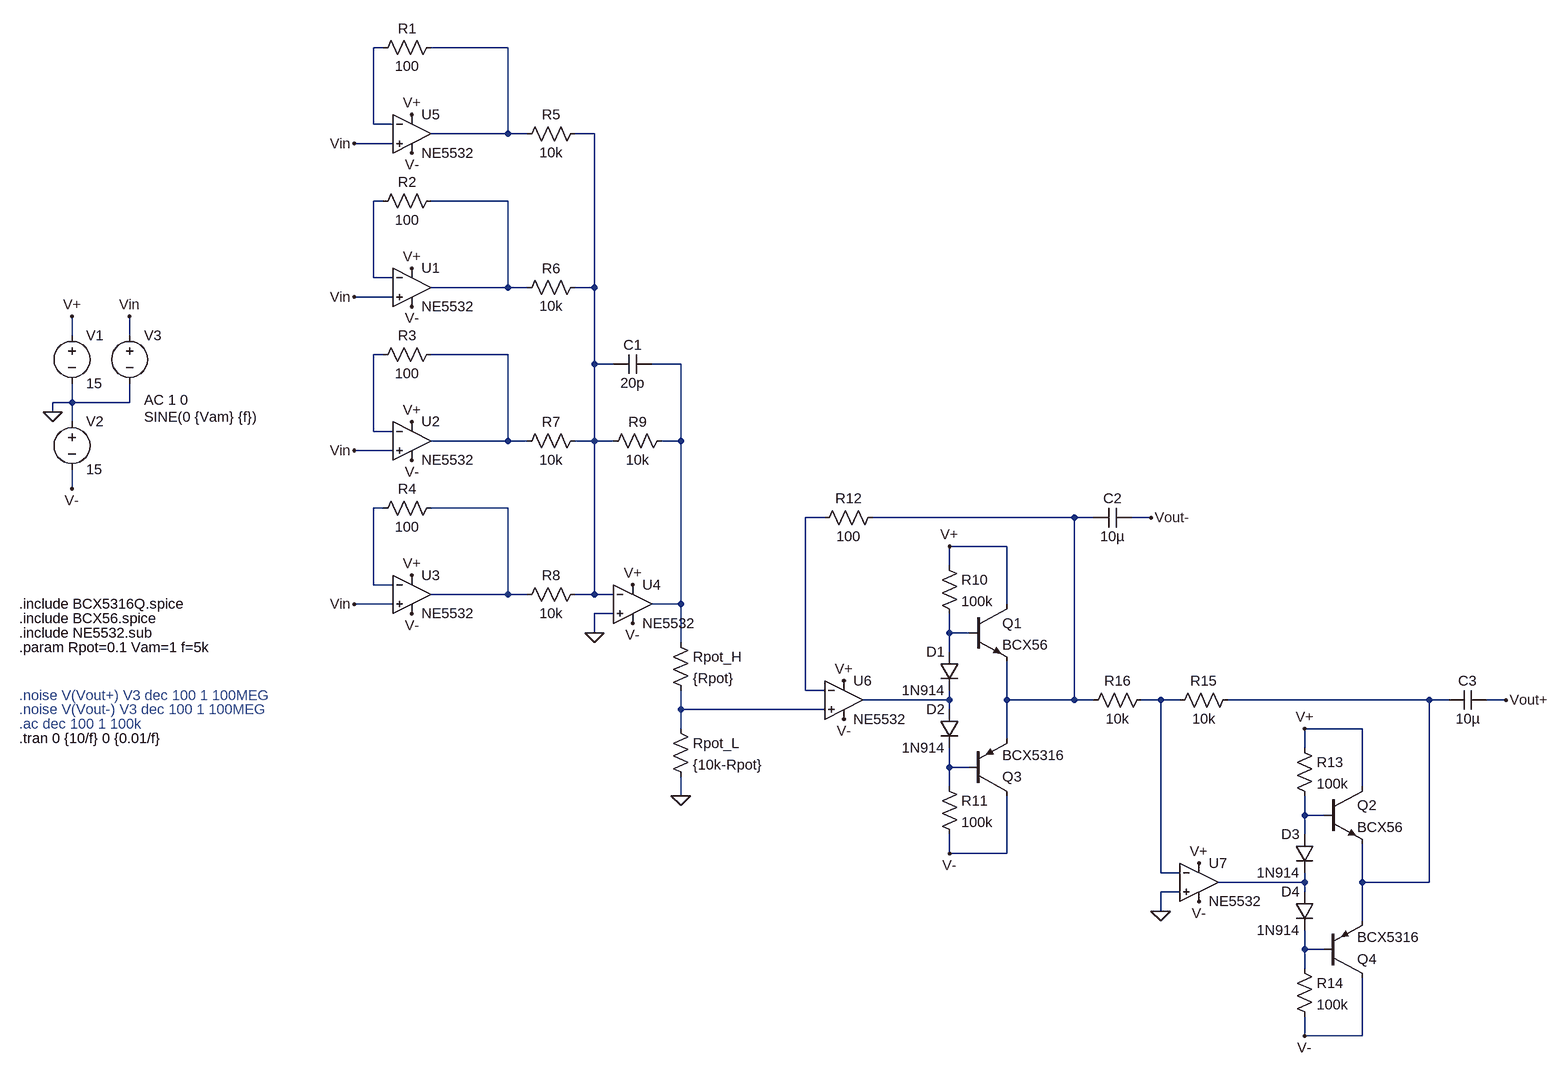
[diagram p0: schematic 4ChannelMixer.asc]
4ChannelMixer.asc, the LTspice schematic file:
Version 4.1
SHEET 1 2868 2084
WIRE 432 -464 416 -464
WIRE 640 -464 512 -464
WIRE 416 -336 416 -464
WIRE 448 -336 416 -336
WIRE 640 -320 640 -464
WIRE 640 -320 512 -320
WIRE 672 -320 640 -320
WIRE 784 -320 752 -320
WIRE 448 -304 384 -304
WIRE 432 -208 416 -208
WIRE 640 -208 512 -208
WIRE 416 -80 416 -208
WIRE 448 -80 416 -80
WIRE 640 -64 640 -208
WIRE 640 -64 512 -64
WIRE 672 -64 640 -64
WIRE 784 -64 784 -320
WIRE 784 -64 752 -64
WIRE 448 -48 384 -48
WIRE -832 16 -832 -16
WIRE -736 16 -736 -16
WIRE 432 48 416 48
WIRE 640 48 512 48
WIRE 784 64 784 -64
WIRE 816 64 784 64
WIRE 928 64 880 64
WIRE -832 128 -832 96
WIRE -832 128 -864 128
WIRE -736 128 -736 96
WIRE -736 128 -832 128
WIRE -864 144 -864 128
WIRE -832 160 -832 128
WIRE 416 176 416 48
WIRE 448 176 416 176
WIRE 640 192 640 48
WIRE 640 192 512 192
WIRE 672 192 640 192
WIRE 784 192 784 64
WIRE 784 192 752 192
WIRE 816 192 784 192
WIRE 928 192 928 64
WIRE 928 192 896 192
WIRE 448 208 384 208
WIRE -832 272 -832 240
WIRE 432 304 416 304
WIRE 640 304 512 304
WIRE 1168 320 1136 320
WIRE 1584 320 1248 320
WIRE 1616 320 1584 320
WIRE 1712 320 1680 320
WIRE 1472 368 1376 368
WIRE 1376 400 1376 368
WIRE 416 432 416 304
WIRE 448 432 416 432
WIRE 640 448 640 304
WIRE 640 448 512 448
WIRE 672 448 640 448
WIRE 784 448 784 192
WIRE 784 448 752 448
WIRE 816 448 784 448
WIRE 448 464 384 464
WIRE 928 464 928 192
WIRE 928 464 880 464
WIRE 1472 464 1472 368
WIRE 816 480 784 480
WIRE 784 512 784 480
WIRE 1376 512 1376 480
WIRE 1408 512 1376 512
WIRE 928 528 928 464
WIRE 1376 544 1376 512
WIRE 1136 608 1136 320
WIRE 1168 608 1136 608
WIRE 1376 624 1376 608
WIRE 1376 624 1232 624
WIRE 1472 624 1472 560
WIRE 1584 624 1584 320
WIRE 1584 624 1472 624
WIRE 1616 624 1584 624
WIRE 1728 624 1696 624
WIRE 1760 624 1728 624
WIRE 2176 624 1840 624
WIRE 2208 624 2176 624
WIRE 2304 624 2272 624
WIRE 928 640 928 608
WIRE 1168 640 928 640
WIRE 1376 640 1376 624
WIRE 928 672 928 640
WIRE 2064 672 1968 672
WIRE 1472 688 1472 624
WIRE 1968 704 1968 672
WIRE 1376 736 1376 704
WIRE 1408 736 1376 736
WIRE 1376 768 1376 736
WIRE 2064 768 2064 672
WIRE 928 784 928 752
WIRE 1968 816 1968 784
WIRE 2000 816 1968 816
WIRE 1968 848 1968 816
WIRE 1376 880 1376 848
WIRE 1472 880 1472 784
WIRE 1472 880 1376 880
WIRE 1728 912 1728 624
WIRE 1760 912 1728 912
WIRE 1968 928 1968 912
WIRE 1968 928 1824 928
WIRE 2064 928 2064 864
WIRE 2176 928 2176 624
WIRE 2176 928 2064 928
WIRE 1760 944 1728 944
WIRE 1968 944 1968 928
WIRE 1728 976 1728 944
WIRE 2064 992 2064 928
WIRE 1968 1040 1968 1008
WIRE 2000 1040 1968 1040
WIRE 1968 1072 1968 1040
WIRE 1968 1184 1968 1152
WIRE 2064 1184 2064 1088
WIRE 2064 1184 1968 1184
FLAG -864 144 0
FLAG -832 -16 V+
FLAG -832 272 V-
FLAG -736 -16 Vin
FLAG 480 -352 V+
FLAG 480 -288 V-
FLAG 384 -304 Vin
FLAG 480 -96 V+
FLAG 480 -32 V-
FLAG 384 -48 Vin
FLAG 480 160 V+
FLAG 480 224 V-
FLAG 384 208 Vin
FLAG 480 416 V+
FLAG 480 480 V-
FLAG 384 464 Vin
FLAG 848 432 V+
FLAG 848 496 V-
FLAG 784 512 0
FLAG 928 784 0
FLAG 1200 592 V+
FLAG 1200 656 V-
FLAG 1376 368 V+
FLAG 1376 880 V-
FLAG 1792 896 V+
FLAG 1792 960 V-
FLAG 1968 672 V+
FLAG 1968 1184 V-
FLAG 1728 976 0
FLAG 1712 320 Vout-
FLAG 2304 624 Vout+
SYMBOL voltage -832 0 R0
SYMATTR InstName V1
SYMATTR Value 15
SYMBOL voltage -832 144 R0
SYMATTR InstName V2
SYMATTR Value 15
SYMBOL voltage -736 0 R0
WINDOW 123 24 124 Left 2
WINDOW 39 0 0 Left 0
WINDOW 3 24 152 Left 2
SYMATTR Value2 AC 1 0
SYMATTR Value SINE(0 {Vam} {f})
SYMATTR InstName V3
SYMBOL OpAmps\\opamp2 480 -384 R0
SYMATTR InstName U5
SYMATTR Value NE5532
SYMBOL res 528 -480 R90
WINDOW 0 0 56 VBottom 2
WINDOW 3 32 56 VTop 2
SYMATTR InstName R1
SYMATTR Value 100
SYMBOL OpAmps\\opamp2 480 -128 R0
SYMATTR InstName U1
SYMATTR Value NE5532
SYMBOL res 528 -224 R90
WINDOW 0 0 56 VBottom 2
WINDOW 3 32 56 VTop 2
SYMATTR InstName R2
SYMATTR Value 100
SYMBOL OpAmps\\opamp2 480 128 R0
SYMATTR InstName U2
SYMATTR Value NE5532
SYMBOL res 528 32 R90
WINDOW 0 0 56 VBottom 2
WINDOW 3 32 56 VTop 2
SYMATTR InstName R3
SYMATTR Value 100
SYMBOL OpAmps\\opamp2 480 384 R0
SYMATTR InstName U3
SYMATTR Value NE5532
SYMBOL res 528 288 R90
WINDOW 0 0 56 VBottom 2
WINDOW 3 32 56 VTop 2
SYMATTR InstName R4
SYMATTR Value 100
SYMBOL res 768 -336 R90
WINDOW 0 0 56 VBottom 2
WINDOW 3 32 56 VTop 2
SYMATTR InstName R5
SYMATTR Value 10k
SYMBOL res 768 -80 R90
WINDOW 0 0 56 VBottom 2
WINDOW 3 32 56 VTop 2
SYMATTR InstName R6
SYMATTR Value 10k
SYMBOL res 768 176 R90
WINDOW 0 0 56 VBottom 2
WINDOW 3 32 56 VTop 2
SYMATTR InstName R7
SYMATTR Value 10k
SYMBOL res 768 432 R90
WINDOW 0 0 56 VBottom 2
WINDOW 3 32 56 VTop 2
SYMATTR InstName R8
SYMATTR Value 10k
SYMBOL OpAmps\\opamp2 848 400 R0
SYMATTR InstName U4
SYMATTR Value NE5532
SYMBOL res 912 176 R90
WINDOW 0 0 56 VBottom 2
WINDOW 3 32 56 VTop 2
SYMATTR InstName R9
SYMATTR Value 10k
SYMBOL cap 880 48 R90
WINDOW 0 0 32 VBottom 2
WINDOW 3 32 32 VTop 2
SYMATTR InstName C1
SYMATTR Value 20p
SYMBOL res 912 512 R0
SYMATTR InstName Rpot_H
SYMATTR Value {Rpot}
SYMBOL res 912 656 R0
SYMATTR InstName Rpot_L
SYMATTR Value {10k-Rpot}
SYMBOL OpAmps\\opamp2 1200 560 R0
SYMATTR InstName U6
SYMATTR Value NE5532
SYMBOL diode 1392 544 M0
SYMATTR InstName D1
SYMATTR Value 1N914
SYMBOL diode 1392 640 M0
SYMATTR InstName D2
SYMATTR Value 1N914
SYMBOL res 1360 384 R0
SYMATTR InstName R10
SYMATTR Value 100k
SYMBOL res 1360 752 R0
SYMATTR InstName R11
SYMATTR Value 100k
SYMBOL res 1264 304 R90
WINDOW 0 0 56 VBottom 2
WINDOW 3 32 56 VTop 2
SYMATTR InstName R12
SYMATTR Value 100
SYMBOL OpAmps\\opamp2 1792 864 R0
SYMATTR InstName U7
SYMATTR Value NE5532
SYMBOL diode 1984 848 M0
SYMATTR InstName D3
SYMATTR Value 1N914
SYMBOL diode 1984 944 M0
SYMATTR InstName D4
SYMATTR Value 1N914
SYMBOL res 1952 688 R0
SYMATTR InstName R13
SYMATTR Value 100k
SYMBOL res 1952 1056 R0
SYMATTR InstName R14
SYMATTR Value 100k
SYMBOL res 1856 608 R90
WINDOW 0 0 56 VBottom 2
WINDOW 3 32 56 VTop 2
SYMATTR InstName R15
SYMATTR Value 10k
SYMBOL res 1712 608 R90
WINDOW 0 0 56 VBottom 2
WINDOW 3 32 56 VTop 2
SYMATTR InstName R16
SYMATTR Value 10k
SYMBOL cap 1680 304 R90
WINDOW 0 0 32 VBottom 2
WINDOW 3 32 32 VTop 2
SYMATTR InstName C2
SYMATTR Value 10µ
SYMBOL cap 2272 608 R90
WINDOW 0 0 32 VBottom 2
WINDOW 3 32 32 VTop 2
SYMATTR InstName C3
SYMATTR Value 10µ
SYMBOL npn 1408 464 R0
SYMATTR InstName Q1
SYMATTR Value BCX56
SYMBOL npn 2000 768 R0
SYMATTR InstName Q2
SYMATTR Value BCX56
SYMBOL pnp 1408 784 M180
SYMATTR InstName Q3
SYMATTR Value BCX5316
SYMBOL pnp 2000 1088 M180
SYMATTR InstName Q4
SYMATTR Value BCX5316
TEXT -920 536 Left 2 !.param Rpot=0.1 Vam=1 f=5k
TEXT -920 512 Left 2 !.include NE5532.sub
TEXT -920 616 Left 2 ;.noise V(Vout+) V3 dec 100 1 100MEG
TEXT -920 640 Left 2 ;.noise V(Vout-) V3 dec 100 1 100MEG
TEXT -920 488 Left 2 !.include BCX56.spice
TEXT -920 464 Left 2 !.include BCX5316Q.spice
TEXT -920 664 Left 2 ;.ac dec 100 1 100k
TEXT -920 688 Left 2 !.tran 0 {10/f} 0 {0.01/f}

The netlist it stands for:
* 4ChannelMixer.asc
V1 V+ 0 15
V2 0 V- 15
V3 Vin 0 SINE(0 {Vam} {f}) AC 1 0
X§U5 Vin N001 V+ V- N002 NE5532  ; pins In+ In- V+ V- OUT
R1 N002 N001 100
X§U1 Vin N004 V+ V- N005 NE5532  ; pins In+ In- V+ V- OUT
R2 N005 N004 100
X§U2 Vin N006 V+ V- N007 NE5532  ; pins In+ In- V+ V- OUT
R3 N007 N006 100
X§U3 Vin N009 V+ V- N010 NE5532  ; pins In+ In- V+ V- OUT
R4 N010 N009 100
R5 N003 N002 10k
R6 N003 N005 10k
R7 N003 N007 10k
R8 N003 N010 10k
X§U4 0 N003 V+ V- N008 NE5532  ; pins In+ In- V+ V- OUT
R9 N008 N003 10k
C1 N008 N003 20p
Rpot_H N008 N017 {Rpot}
Rpot_L N017 0 {10k-Rpot}
X§U6 N017 N011 V+ V- N014 NE5532  ; pins In+ In- V+ V- OUT
D1 N013 N014 1N914
D2 N014 N018 1N914
R10 V+ N013 100k
R11 N018 V- 100k
R12 N012 N011 100
X§U7 0 N015 V+ V- N020 NE5532  ; pins In+ In- V+ V- OUT
D3 N019 N020 1N914
D4 N020 N021 1N914
R13 V+ N019 100k
R14 N021 V- 100k
R15 N016 N015 10k
R16 N015 N012 10k
C2 Vout- N012 10µ
C3 Vout+ N016 10µ
Q1 V+ N013 N012 0 BCX56
Q2 V+ N019 N016 0 BCX56
Q3 V- N018 N012 0 BCX5316
Q4 V- N021 N016 0 BCX5316
.model D D
.lib standard.dio
.model NPN NPN
.model PNP PNP
.lib standard.bjt
.param Rpot=0.1 Vam=1 f=5k
.include NE5532.sub
* .noise V(Vout+) V3 dec 100 1 100MEG
* .noise V(Vout-) V3 dec 100 1 100MEG
.include BCX56.spice
.include BCX5316Q.spice
* .ac dec 100 1 100k
.tran 0 {10/f} 0 {0.01/f}
.backanno
.end